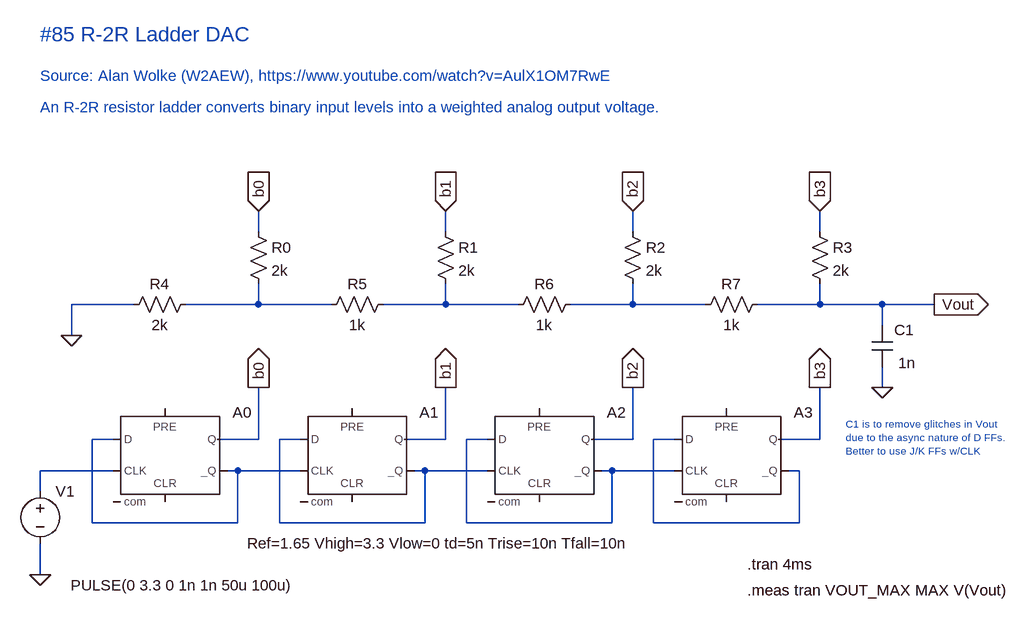
[diagram p0: schematic R-2R Ladder DAC.asc]
R-2R Ladder DAC.asc, the LTspice schematic file:
Version 4.1
SHEET 1 1488 680
WIRE 272 32 272 0
WIRE 560 32 560 0
WIRE 848 32 848 0
WIRE 1136 32 1136 0
WIRE 80 144 -16 144
WIRE 272 144 272 112
WIRE 272 144 160 144
WIRE 384 144 272 144
WIRE 560 144 560 112
WIRE 560 144 464 144
WIRE 672 144 560 144
WIRE 848 144 848 112
WIRE 848 144 752 144
WIRE 960 144 848 144
WIRE 1136 144 1136 112
WIRE 1136 144 1040 144
WIRE 1232 144 1136 144
WIRE 1312 144 1232 144
WIRE 1232 176 1232 144
WIRE -16 192 -16 144
WIRE 1232 272 1232 240
WIRE 48 352 16 352
WIRE 272 352 272 272
WIRE 272 352 208 352
WIRE 336 352 304 352
WIRE 560 352 560 272
WIRE 560 352 496 352
WIRE 624 352 592 352
WIRE 848 352 848 272
WIRE 848 352 784 352
WIRE 912 352 880 352
WIRE 1136 352 1136 272
WIRE 1136 352 1072 352
WIRE 48 400 -64 400
WIRE 240 400 224 400
WIRE 336 400 240 400
WIRE 528 400 512 400
WIRE 624 400 528 400
WIRE 816 400 800 400
WIRE 912 400 816 400
WIRE 1104 400 1088 400
WIRE -64 432 -64 400
WIRE 16 480 16 352
WIRE 240 480 240 400
WIRE 240 480 16 480
WIRE 304 480 304 352
WIRE 528 480 528 400
WIRE 528 480 304 480
WIRE 592 480 592 352
WIRE 816 480 816 400
WIRE 816 480 592 480
WIRE 880 480 880 352
WIRE 1104 480 1104 400
WIRE 1104 480 880 480
WIRE -64 560 -64 512
FLAG 1312 144 Vout
IOPIN 1312 144 Out
FLAG 272 0 b0
IOPIN 272 0 In
FLAG 560 0 b1
IOPIN 560 0 In
FLAG 848 0 b2
IOPIN 848 0 In
FLAG 1136 0 b3
IOPIN 1136 0 In
FLAG -16 192 0
FLAG 272 272 b0
IOPIN 272 272 Out
FLAG 560 272 b1
IOPIN 560 272 Out
FLAG 848 272 b2
IOPIN 848 272 Out
FLAG 1136 272 b3
IOPIN 1136 272 Out
FLAG -64 560 0
FLAG 1232 272 0
SYMBOL res 256 16 R0
SYMATTR InstName R0
SYMATTR Value 2k
SYMBOL res 176 128 R90
WINDOW 0 0 56 VBottom 2
WINDOW 3 32 56 VTop 2
SYMATTR InstName R4
SYMATTR Value 2k
SYMBOL res 480 128 R90
WINDOW 0 0 56 VBottom 2
WINDOW 3 32 56 VTop 2
SYMATTR InstName R5
SYMATTR Value 1k
SYMBOL res 544 16 R0
SYMATTR InstName R1
SYMATTR Value 2k
SYMBOL res 768 128 R90
WINDOW 0 0 56 VBottom 2
WINDOW 3 32 56 VTop 2
SYMATTR InstName R6
SYMATTR Value 1k
SYMBOL res 832 16 R0
SYMATTR InstName R2
SYMATTR Value 2k
SYMBOL res 1056 128 R90
WINDOW 0 0 56 VBottom 2
WINDOW 3 32 56 VTop 2
SYMATTR InstName R7
SYMATTR Value 1k
SYMBOL res 1120 16 R0
SYMATTR InstName R3
SYMATTR Value 2k
SYMBOL Digital\\dflop 416 304 R0
WINDOW 3 -17 197 Invisible 2
SYMATTR Value Ref=1.65 Vhigh=3.3 Vlow=0 td=5n Trise=10n Tfall=10n
SYMATTR InstName A1
SYMBOL Digital\\dflop 704 304 R0
WINDOW 3 8 168 Invisible 2
SYMATTR Value Ref=1.65 Vhigh=3.3 Vlow=0 td=5n Trise=10n Tfall=10n
SYMATTR InstName A2
SYMBOL Digital\\dflop 992 304 R0
WINDOW 3 8 168 Invisible 2
SYMATTR Value Ref=1.65 Vhigh=3.3 Vlow=0 td=5n Trise=10n Tfall=10n
SYMATTR InstName A3
SYMBOL voltage -64 416 R0
WINDOW 3 47 160 Left 2
WINDOW 123 0 0 Left 0
WINDOW 39 0 0 Left 0
SYMATTR Value PULSE(0 3.3 0 1n 1n 50u 100u)
SYMATTR InstName V1
SYMBOL Digital\\dflop 128 304 R0
WINDOW 3 126 208 Left 2
SYMATTR Value Ref=1.65 Vhigh=3.3 Vlow=0 td=5n Trise=10n Tfall=10n
SYMATTR InstName A0
SYMBOL cap 1248 176 M0
WINDOW 0 -33 7 Left 2
WINDOW 3 -36 58 Left 2
SYMATTR InstName C1
SYMATTR Value 1n
TEXT 1024 544 Left 2 !.tran 4ms
TEXT 1024 584 Left 2 !.meas tran VOUT_MAX MAX V(Vout)
TEXT 1176 328 Left 1 ;C1 is to remove glitches in Vout\ndue to the async nature of D FFs.\nBetter to use J/K FFs w/CLK
TEXT -64 -272 Left 3 ;#85 R-2R Ladder DAC
TEXT -64 -208 Left 2 ;Source: Alan Wolke (W2AEW), https://www.youtube.com/watch?v=AulX1OM7RwE
TEXT -64 -160 Left 2 ;An R-2R resistor ladder converts binary input levels into a weighted analog output voltage.

The netlist it stands for:
* R-2R Ladder DAC.asc
R0 b0 N001 2k
R4 N001 0 2k
R5 N002 N001 1k
R1 b1 N002 2k
R6 N003 N002 1k
R2 b2 N003 2k
R7 Vout N003 1k
R3 b3 Vout 2k
A1 N005 0 N004 0 0 N005 b1 0 DFLOP Ref=1.65 Vhigh=3.3 Vlow=0 td=5n Trise=10n Tfall=10n
A2 N006 0 N005 0 0 N006 b2 0 DFLOP Ref=1.65 Vhigh=3.3 Vlow=0 td=5n Trise=10n Tfall=10n
A3 N007 0 N006 0 0 N007 b3 0 DFLOP Ref=1.65 Vhigh=3.3 Vlow=0 td=5n Trise=10n Tfall=10n
V1 N008 0 PULSE(0 3.3 0 1n 1n 50u 100u)
A0 N004 0 N008 0 0 N004 b0 0 DFLOP Ref=1.65 Vhigh=3.3 Vlow=0 td=5n Trise=10n Tfall=10n
C1 Vout 0 1n
.tran 4ms
.meas tran VOUT_MAX MAX V(Vout)
* C1 is to remove glitches in Vout
* due to the async nature of D FFs.
* Better to use J/K FFs w/CLK
* #85 R-2R Ladder DAC
* Source: Alan Wolke (W2AEW), https://www.youtube.com/watch?v=AulX1OM7RwE
* An R-2R resistor ladder converts binary input levels into a weighted analog output voltage.
.backanno
.end